# Altium schematic sheet Audio_Section.SchDoc
size A4; DocumentNumber: 6; SheetNumber: 6; SheetTotal: 28
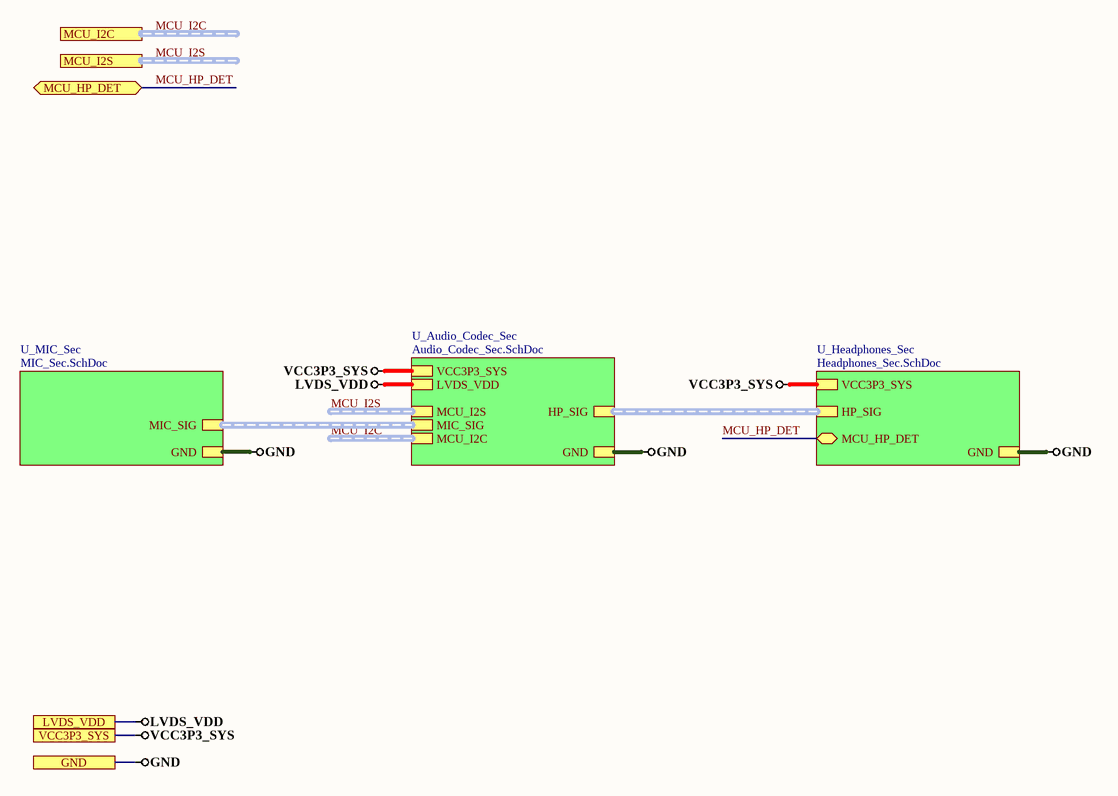
[diagram p0: Audio_Section.SchDoc]

## Sub-sheets
U_Audio_Codec_Sec = Audio_Codec_Sec.SchDoc: HP_SIG (harness HP_SIG), MCU_I2S (harness MCU_I2S), MIC_SIG (harness MIC_SIG), VCC3P3_SYS, LVDS_VDD, GND, MCU_I2C (harness MCU_I2C)
U_Headphones_Sec = Headphones_Sec.SchDoc: HP_SIG (harness HP_SIG), MCU_HP_DET (bidir), VCC3P3_SYS, GND
U_MIC_Sec = MIC_Sec.SchDoc: MIC_SIG (harness MIC_SIG), GND

## Ports
GND, LVDS_VDD, MCU_HP_DET (bidir), MCU_I2C (harness MCU_I2C), MCU_I2S (harness MCU_I2S), VCC3P3_SYS

## Nets
GND: port GND, sheet U_MIC_Sec/GND, sheet U_Audio_Codec_Sec/GND, sheet U_Headphones_Sec/GND
LVDS_VDD: port LVDS_VDD, sheet U_Audio_Codec_Sec/LVDS_VDD
VCC3P3_SYS: port VCC3P3_SYS, sheet U_Audio_Codec_Sec/VCC3P3_SYS, sheet U_Headphones_Sec/VCC3P3_SYS
MCU_HP_DET: port MCU_HP_DET, sheet U_Headphones_Sec/MCU_HP_DET

## Buses and harness runs
harness MCU_I2C = port MCU_I2C
harness MCU_I2C = sheet U_Audio_Codec_Sec/MCU_I2C
harness MCU_I2S = port MCU_I2S
harness MCU_I2S = sheet U_Audio_Codec_Sec/MCU_I2S
harness sheet U_Audio_Codec_Sec/HP_SIG = sheet U_Headphones_Sec/HP_SIG
harness sheet U_Audio_Codec_Sec/MIC_SIG = sheet U_MIC_Sec/MIC_SIG